# Altium schematic sheet WiFiModule_Section.SchDoc
size A4; SheetNumber: 5; SheetTotal: 6
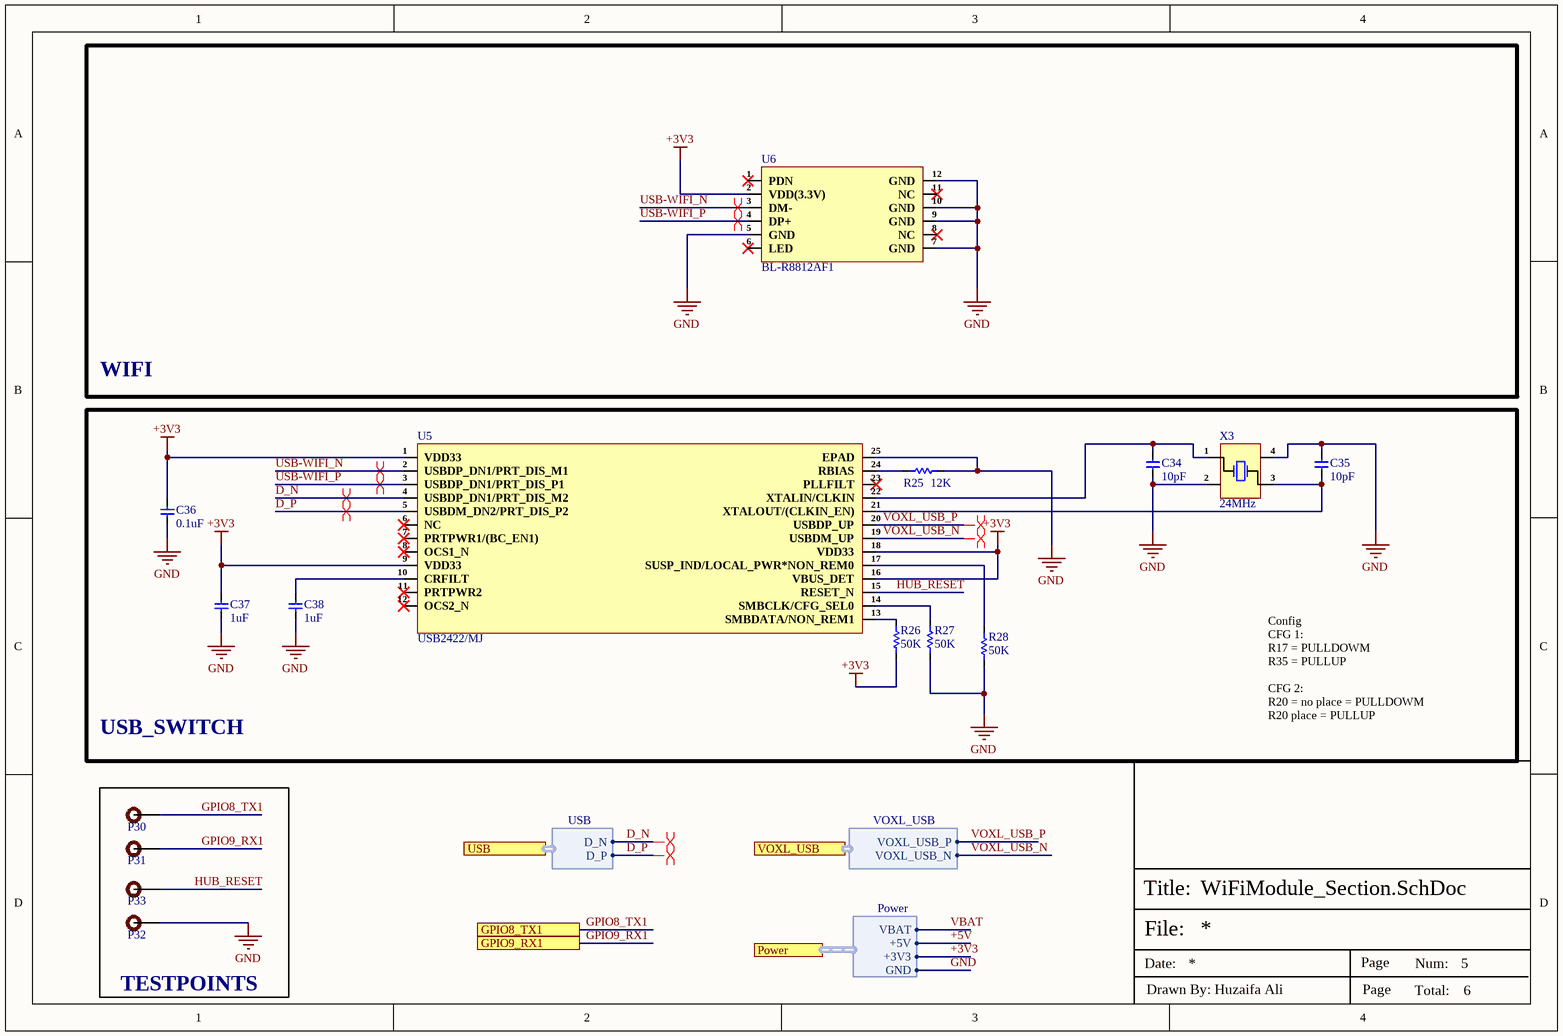
[diagram p0: WiFiModule_Section.SchDoc]

## Parts
C34  10pF  [Cap-0603]
C35  10pF  [Cap-0603]
C36  0.1uF  [Cap-0603]
C37  1uF  [Cap-0603]
C38  1uF  [Cap-0603]
P30  TEST POINT  [Test-point]  (value not drawn)
P31  TEST POINT  [Test-point]  (value not drawn)
P32  TEST POINT  [Test-point]  (value not drawn)
P33  TEST POINT  [Test-point]  (value not drawn)
R25  12K  [Res-0603]
R26  50K  [Res-0603]
R27  50K  [Res-0603]
R28  50K  [Res-0603]
U5  USB2422/MJ  [24-QFN (4x4)]
U6  BL-R8812AF1  [BL-R8812AF1]
X3  24MHz  [MCSJK-7U-24.00-12-10-60-B-10]

## Blocks framed on the sheet
WIFI: U6
USB_SWITCH: C34-C38 R25-R28 U5 X3
TESTPOINTS: P30-P33

## Ports
GPIO8_TX1 (see Top-Sheet[3C], Controller_Section[1D]), GPIO9_RX1 (see Top-Sheet[3C], Controller_Section[1D]), Power (harness Power, see Top-Sheet[3B], Connector_Section[4D], Controller_Section[2D], FlashMemory_Section[1D], Power_Section[3D]), USB (harness USB, see Top-Sheet[3C], Controller_Section[1D]), VOXL_USB (harness VOXL_USB, see Top-Sheet[3C], Connector_Section[2C])

## Harnesses
VOXL_USB: VOXL_USB_P, VOXL_USB_N
USB: D_N, D_P
Power: +5V, +3V3, GND, VBAT

## Nets
+3V3: C36.2 C37.2 R26.1 U5.1(VDD33) U5.9(VDD33) U5.16(VBUS_DET) U5.18(VDD33) U6.2(VDD(3.3V)) ; port Power.+3V3
GND: C34.1 C35.2 C36.1 C37.1 C38.1 P32.1 R25.2 R27.1 R28.1 U5.25(EPAD) U6.5(GND) U6.7(GND) U6.9(GND) U6.10(GND) U6.12(GND) X3.2(GND) X3.4(VDD) ; port Power.GND
+5V: port Power.+5V
D_N: U5.4(USBDP_DN1/PRT_DIS_M2) ; port USB.D_N
D_P: U5.5(USBDM_DN2/PRT_DIS_P2) ; port USB.D_P
GPIO8_TX1: P30.1 ; port GPIO8_TX1
GPIO9_RX1: P31.1 ; port GPIO9_RX1
HUB_RESET: P33.1 U5.15(RESET_N)
USB-WIFI_N: U5.2(USBDP_DN1/PRT_DIS_M1) U6.3(DM-)
USB-WIFI_P: U5.3(USBDP_DN1/PRT_DIS_P1) U6.4(DP+)
VBAT: port Power.VBAT
VOXL_USB_N: U5.19(USBDM_UP) ; port VOXL_USB.VOXL_USB_N
VOXL_USB_P: U5.20(USBDP_UP) ; port VOXL_USB.VOXL_USB_P
NetC34_2: C34.2 U5.22(XTALIN/CLKIN) X3.1(ENABLE_CONTROL)
NetC35_1: C35.1 U5.21(XTALOUT/(CLKIN_EN)) X3.3(OUT_PUT)
NetC38_2: C38.2 U5.10(CRFILT)
NetR25_1: R25.1 U5.24(RBIAS)
NetR26_2: R26.2 U5.13(SMBDATA/NON_REM1)
NetR27_2: R27.2 U5.14(SMBCLK/CFG_SEL0)
NetR28_2: R28.2 U5.17(SUSP_IND/LOCAL_PWR*NON_REM0)

Not connected (* = marked no-connect by the designer): U5 6(NC)* 7(PRTPWR1/(BC_EN1))* 8(OCS1_N)* 11(PRTPWR2)* 12(OCS2_N)* 23(PLLFILT)*; U6 1(PDN)* 6(LED)* 8(NC)* 11(NC)*

## Layout directives
differential pair; rule Impedance Constraint [Min = 88.00    Max = 102.0    ]; rule Matched Net Lengths [Tolerance = 0.508mm]; net class D; differential pair class D_Lines: D_N, D_P
differential pair; net class USB-WIFI; differential pair class USB_WIFI_Lines; rule Matched Net Lengths [Tolerance = 0.508mm]; rule Impedance Constraint [Min = 88.00    Max = 102.0    ]: USB-WIFI_N, USB-WIFI_P
differential pair; net class VOXL_USB; differential pair class VOXL_USB_Lines; rule Matched Net Lengths [Tolerance = 0.508mm]; rule Impedance Constraint [Min = 88.00    Max = 102.0    ]: VOXL_USB_N, VOXL_USB_P

## Notes on the sheet
- Config
  CFG 1:
  R17 = PULLDOWM
  R35 = PULLUP
  CFG 2:
  R20 = no place = PULLDOWM
  R20 place = PULLUP
- File:
- Title:
- Date:
- Page
- Num:
- Total:
- Drawn By: Huzaifa Ali

## Library data of the parts
C34 C35 = CC0603JRNPO9BN100: CAP CER 10PF 50V C0G/NPO 0603; Manufacturer: Yageo; Tolerance: 5%; Dielectric: C0G; Temperature Coefficient: 30ppm/°C; Insulation Resistance: 100GR; ComponentLink1URL: https://datasheet.ciiva.com/25787/cl10a475ka8nqnc-25787017.pdf?src-supplier=Digi-Key; ComponentLink1Description: https://datasheet.ciiva.com/25787/cl10a475ka8nqnc-25787017.pdf?src-supplier=Digi-Key; ComponentLink2URL: https://datasheet.ciiva.com/144/mlccorderingcode-144651.pdf?src-supplier=Digi-Key; ComponentLink2Description: https://datasheet.ciiva.com/144/mlccorderingcode-144651.pdf?src-supplier=Digi-Key; ComponentLink3URL: https://datasheet.ciiva.com/11786/0900766b8079c870-11786407.pdf?src-supplier=RSComponents; ComponentLink3Description: https://datasheet.ciiva.com/11786/0900766b8079c870-11786407.pdf?src-supplier=RSComponents; ComponentLink4URL: https://datasheet.ciiva.com/5789/1734582-5789616.pdf?src-supplier=Farnell; ComponentLink4Description: https://datasheet.ciiva.com/5789/1734582-5789616.pdf?src-supplier=Farnell; ComponentLink5URL: https://datasheet.ciiva.com/26862/getdatasheetpartid-403524-26862758.pdf?src-supplier=Verical; ComponentLink5Description: https://datasheet.ciiva.com/26862/getdatasheetpartid-403524-26862758.pdf?src-supplier=Verical; ComponentLink6URL: https://datasheet.ciiva.com/7978/1132289-7978126.pdf?src-supplier=Element14; ComponentLink6Description: https://datasheet.ciiva.com/7978/1132289-7978126.pdf?src-supplier=Element14; ComponentLink7URL: https://datasheet.ciiva.com/46430/1835847-46430150.pdf?src-supplier=Element14; ComponentLink7Description: https://datasheet.ciiva.com/46430/1835847-46430150.pdf?src-supplier=Element14; ComponentLink8URL: https://datasheet.ciiva.com/144/mlccorderingcode-144650.pdf?src-supplier=Digi-Key; ComponentLink8Description: https://datasheet.ciiva.com/144/mlccorderingcode-144650.pdf?src-supplier=Digi-Key; ComponentLink9URL: https://datasheet.ciiva.com/144/mlccorderingcode-144649.pdf?src-supplier=Digi-Key; ComponentLink9Description: https://datasheet.ciiva.com/144/mlccorderingcode-144649.pdf?src-supplier=Digi-Key; ComponentLink10URL: https://datasheet.ciiva.com/5425/upy-gp-np0-16v-to-50v-8-5425564.pdf?src-supplier=Mouser; ComponentLink10Description: https://datasheet.ciiva.com/5425/upy-gp-np0-16v-to-50v-8-5425564.pdf?src-supplier=Mouser; ComponentLink11URL: https://datasheet.ciiva.com/8033/1734582-8033710.pdf?src-supplier=Element14; ComponentLink11Description: https://datasheet.ciiva.com/8033/1734582-8033710.pdf?src-supplier=Element14; ComponentLink12URL: https://datasheet.ciiva.com/8033/1734582-8033706.pdf?src-supplier=Element14; ComponentLink12Description: https://datasheet.ciiva.com/8033/1734582-8033706.pdf?src-supplier=Element14; Supplier 1: Digi-Key; Manufacturer Part Number: CC0603JRNPO9BN100; RoHS: Yes; Category: Ceramic Capacitors; Stock 1: 1700978; Pricing 1: 1=0.10000, 10=0.03900, 50=0.02120, 100=0.01740, 500=0.01240, 1000=0.00974 (USD); Mount: Surface Mount; Case/Package: 0603; Number of Pins: 2; Case Code (Metric): 1608; Case Code (Imperial): 0603; Min Operating Temperature: -55°C; Max Operating Temperature: 125°C; Capacitance: 10pF; Voltage: 50V; Voltage Rating: 50V; Voltage Rating (DC): 50V; Packaging: Tape and Reel; Package Quantity: 1; Termination: SMD/SMT; Resistor Type: Ceramic; Series: CC; Length: 1.6mm; Width: 0.031inch; Height: 0.8mm; Thickness: 0.035inch; Depth: 0.8mm; Radiation Hardening: No; RoHS Compliant: Yes; REACH SVHC: No SVHC; Lead Free: Lead Free; Supplier Part Number 1: 311-1058-1-ND; LCSC Part Number: C106245
C36 = CL10B104KB8NNNC: CAP CER 0.1UF 50V X7R 0603; Manufacturer: Samsung; Material: Ceramic; Capacitance: 100nF; Tolerance: 10%; Supplier 1: Digi-Key; Manufacturer Part Number: CL10B104KB8NNNC; RoHS: Yes; Category: Ceramic Capacitors; Stock 1: 3998791; Pricing 1: 1=0.10000, 10=0.03000, 50=0.01640, 100=0.01340, 500=0.00954, 1000=0.00750 (USD); Mount: Surface Mount; Case/Package: 0603; Case Code (Metric): 1608; Case Code (Imperial): 0603; Contact Plating: Tin; Min Operating Temperature: -55°C; Max Operating Temperature: 125°C; Dielectric: X7R; Voltage Rating: 50V; Package Quantity: 1; Packaging: Tape and Reel; Voltage: 50V; Voltage Rating (DC): 50V; Series: CL; Construction: Flat; Length: 1.6mm; Width: 0.031inch; Height: 0.8mm; Depth: 0.8mm; Thickness: 0.035inch; Radiation Hardening: No; Lead Free: Lead Free; RoHS Compliant: Yes; ComponentLink1URL: https://datasheet.ciiva.com/25803/cl10b104kb8nnnc-25803393.pdf?src-supplier=Digi-Key; ComponentLink1Description: https://datasheet.ciiva.com/25803/cl10b104kb8nnnc-25803393.pdf?src-supplier=Digi-Key; ComponentLink2URL: https://datasheet.ciiva.com/26838/getdatasheetpartid-89097-26838411.pdf?src-supplier=Verical; ComponentLink2Description: https://datasheet.ciiva.com/26838/getdatasheetpartid-89097-26838411.pdf?src-supplier=Verical; ComponentLink3URL: https://datasheet.ciiva.com/29198/456651-da-01-en-vs-kondensator-0605-29198839.pdf?src-supplier=Conrad; ComponentLink3Description: https://datasheet.ciiva.com/29198/456651-da-01-en-vs-kondensator-0605-29198839.pdf?src-supplier=Conrad; Supplier Part Number 1: 1276-1000-1-ND; LCSC Part Number: C1591
C37 C38 = CC0603KRX5R8BB105: CAP CER 1UF 25V X5R 0603; Manufacturer: Yageo; Tolerance: 10%; Item Type: Capacitor; Supplier 1: Digi-Key; Manufacturer Part Number: CC0603KRX5R8BB105; RoHS: Yes; Category: Ceramic Capacitors; Stock 1: 919939; Pricing 1: 1=0.12000, 10=0.08400, 50=0.04760, 100=0.03940, 500=0.02764, 1000=0.02288 (USD); Mount: Surface Mount; Case/Package: 0603; Number of Pins: 2; Case Code (Metric): 1608; Case Code (Imperial): 0603; Min Operating Temperature: -55°C; Max Operating Temperature: 85°C; Capacitance: 1uF; Dielectric: X5R; Package Quantity: 1; Voltage Rating: 25V; Packaging: Tape and Reel; Termination: SMD/SMT; Voltage Rating (DC): 25V; Series: CC; Construction: Flat; Length: 1.6mm; Width: 0.031inch; Height: 0.8mm; Thickness: 0.035inch; Depth: 0.8mm; Radiation Hardening: No; REACH SVHC: No SVHC; Lead Free: Lead Free; Halogen Free: Halogen Free; RoHS Compliant: Yes; ComponentLink1URL: https://datasheet.ciiva.com/176/mlccorderingcode-176785.pdf?src-supplier=Digi-Key; ComponentLink1Description: https://datasheet.ciiva.com/176/mlccorderingcode-176785.pdf?src-supplier=Digi-Key; ComponentLink2URL: https://datasheet.ciiva.com/176/mlccorderingcode-176786.pdf?src-supplier=Digi-Key; ComponentLink2Description: https://datasheet.ciiva.com/176/mlccorderingcode-176786.pdf?src-supplier=Digi-Key; ComponentLink3URL: https://datasheet.ciiva.com/176/mlccorderingcode-176787.pdf?src-supplier=Digi-Key; ComponentLink3Description: https://datasheet.ciiva.com/176/mlccorderingcode-176787.pdf?src-supplier=Digi-Key; ComponentLink4URL: https://datasheet.ciiva.com/17436/upy-gphc-x5r-4v-to-50v-12-17436952.pdf?src-supplier=Avnet+Europe; ComponentLink4Description: https://datasheet.ciiva.com/17436/upy-gphc-x5r-4v-to-50v-12-17436952.pdf?src-supplier=Avnet+Europe; ComponentLink5URL: https://datasheet.ciiva.com/7978/1525783-7978171.pdf?src-supplier=Element14; ComponentLink5Description: https://datasheet.ciiva.com/7978/1525783-7978171.pdf?src-supplier=Element14; ComponentLink6URL: https://datasheet.ciiva.com/11586/upy-gphc-x5r-4v-to-50v-12-11586318.pdf?src-supplier=Avnet; ComponentLink6Description: https://datasheet.ciiva.com/11586/upy-gphc-x5r-4v-to-50v-12-11586318.pdf?src-supplier=Avnet; Supplier Part Number 1: 311-1445-1-ND; LCSC Part Number: C14664
P30-P33 = TEST POINT: Test Point ON; Item Type: TEST POINT; Manufacturer Part Number: TEST POINT
R25 = RTT031202BTP: 12kΩ 0603 Chip Resistor - Surface Mount ROHS; Manufacturer: RALEC; Manufacturer Part Number: RTT031202BTP; Footprint: 0603; ComponentLink1Description: LCSC; ComponentLink1URL: https://lcsc.com/product-detail/Chip-span-style-background-color-ff0-Resistor-span-Surface-Mount_RALEC-RTT031202BTP_C2981490.html; LCSC Part Number: C2981490
R26-R28 = RT0603BRD0750KL: RES 50K OHM 0.1% 1/10W 0603; Manufacturer: Yageo; Value: 50kR; Max Power Dissipation: 100mW; Temperature Coefficient: 25ppm/°C; Voltage Rating: 75V; Item Type: Resistor; Supplier: Future Electronics; Supplier Part Number: 3072856; Manufacturer Part Number: RT0603BRD0750KL; RoHS: No; Category: Chip SMD Resistors; Stock: 70000; Pricing: 5000=0.0213, 15000=0.0206, 25000=0.0211, 50000=0.0198, 100000=0.0194, 200000=0.0186 (USD); Case/Package: 0603; Min Operating Temperature: -55°C; Max Operating Temperature: 155°C; Series: RT; Packaging: Tape and Reel; Tolerance: 0.1%; Number of Terminations: 2; Power Rating: 100mW; Height: 550um; ComponentLink1URL: https://www.yageo.com/upload/media/product/productsearch/datasheet/rchip/PYu-RT_1-to-0.01_RoHS_L_12.pdf?src-supplier=Digikey; ComponentLink1Description: https://www.yageo.com/upload/media/product/productsearch/datasheet/rchip/PYu-RT_1-to-0.01_RoHS_L_12.pdf?src-supplier=Digikey; LCSC Part Number: C861451
U5 = USB2422/MJ: Hub Controller USB QFN-24-EP(4x4) USB ICs ROHS; Manufacturer: Microchip; Item Type: IC; Supplier: Avnet; Supplier Part Number: USB2422/MJ; Manufacturer Part Number: USB2422/MJ; RoHS: Yes; Category: USB Interface ICs; Stock: 330; Pricing: 490=1.5 (USD); ComponentLink1URL: http://components.arrow.com/part/dataview/58768923S663889N2064?src-supplier=Arrow+Electronics; ComponentLink1Description: http://components.arrow.com/part/dataview/58768923S663889N2064?src-supplier=Arrow+Electronics; ComponentLink2URL: http://www.mouser.com/ds/2/268/2422-319423.pdf?src-supplier=Mouser; ComponentLink2Description: http://www.mouser.com/ds/2/268/2422-319423.pdf?src-supplier=Mouser; ComponentLink3URL: http://www.microchip.com/mymicrochip/filehandler.aspx?ddocname=en566992&src-supplier=Digikey; ComponentLink3Description: http://www.microchip.com/mymicrochip/filehandler.aspx?ddocname=en566992&src-supplier=Digikey; ComponentLink4URL: https://datasheet.octopart.com/USB2422-MJ-Microchip-datasheet-42223901.pdf?src-supplier=Future+Electronics; ComponentLink4Description: https://datasheet.octopart.com/USB2422-MJ-Microchip-datasheet-42223901.pdf?src-supplier=Future+Electronics; LCSC Part Number: C633330
U6 = BL-R8812AF1: Intelligent WiFiI Module 1200M Dual Band+AC (High Power); Manufacturer: *; Manufacturer Part Number: BL-R8812AF1; ComponentLink1Description: Aliexpress; ComponentLink1URL: https://www.aliexpress.com/item/1005005638445796.html?spm=a2g0o.order_list.order_list_main.29.65f179d27FZF0V&gatewayAdapt=glo2nld; Item Type: Module
X3 = MCSJK-7U-24.00-12-10-60-B-10: Crystal, 24Mhz, 12Pf, 3.2Mm X 2.5Mm; Manufacturer: Multicomp; Supplier: Newark; Supplier Part Number: 56AC8946; Manufacturer Part Number: MCSJK-7U-24.00-12-10-60-B-10; RoHS: No; Stock: 5313; Pricing: 5=0.328, 250=0.253, 500=0.227, 1000=0.207, 5000=0.189 (USD); Item Type: Crystal